# Altium schematic sheet 3V3_Buck.SchDoc
size A; Author: Jared Ainsworth; CompanyName: UpRev LLC; Engineer: Jared Ainsworth; Organization: UpRev LLC; Address1: 4807 Commercial Park Dr.; Address2: Austin, TX 78724; Address3: United States; Address4: www.UpRev.com; SheetNumber: 13; SheetTotal: 13
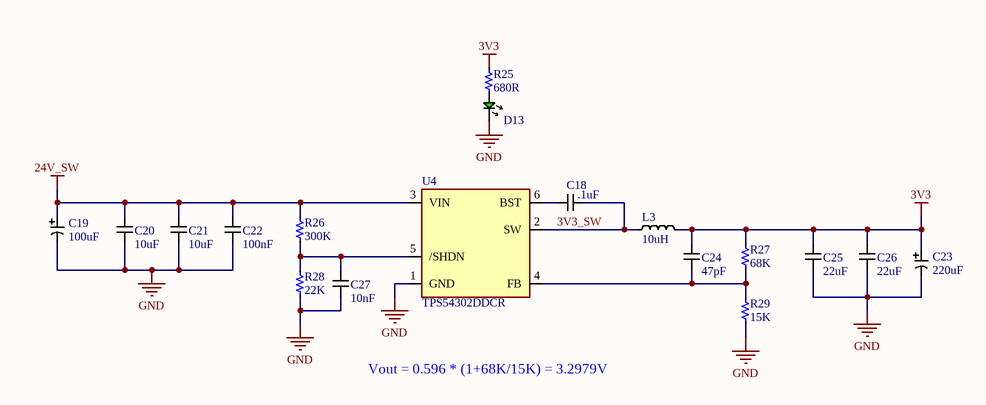
[diagram p0: 3V3_Buck.SchDoc]

## Parts
C18  .1uF  [C0805 (2012)]
C19  100uF  [Cap D8xL10.2mm]
C20  10uF  [C1206 (3216)]
C21  10uF  [C1206 (3216)]
C22  100nF  [C0603 (1608)]
C23  220uF  [Cap D6.3xL7.7mm]
C24  47pF  [C0402 (1005)]
C25  22uF  [C1206 (3216)]
C26  22uF  [C1206 (3216)]
C27  10nF  [C0402 (1005)]
D13  Green  [LED Green 0402 (1005)]  (value not drawn)
L3  10uH  [Inductor 7.2x6.6mm SMD]
R25  680R  [R0402 (1005)]
R26  300K  [R0402 (1005)]
R27  68K  [R0402 (1005)]
R28  22K  [R0402 (1005)]
R29  15K  [R0402 (1005)]
U4  TPS54302DDCR  [SOT-23-6]

## Nets
3V3: C23.1(+) C24.1 C25.1 C26.1 L3.2 R25.2 R27.2
24V_SW: C19.1(+) C20.1 C21.1 C22.1 R26.2 U4.3(VIN)
GND: C19.2 C20.2 C21.2 C22.2 C23.2 C25.2 C26.2 C27.2 D13.1(Gnd) R28.1 R29.1 U4.1(GND)
3V3_SW: C18.2 L3.1 U4.2(SW)
NetC18_1: C18.1 U4.6(BST)
NetC24_2: C24.2 R27.1 R29.2 U4.4(FB)
NetC27_1: C27.1 R26.1 R28.2 U4.5(/SHDN)
NetD13_2: D13.2(+) R25.1

## Notes on the sheet
- Vout = 0.596 * (1+68K/15K) = 3.2979V
- Title
- Size:
- Engineer:
- A
- Number:
- Revision:
- Sheet
- of
- File:

## Library data of the parts
C18 = 100nF Ceramic, 50V, 0805 (2012): 100nF Ceramic Capacitor, 50V, X7R, ±10%, 0805 (2012); Manufacturer Part Number: CL21B104KBCNNNC; Manufacturer: Samsung Electro-Mechanics; Package: 0805 (2012 metric); Value: .1uF; LCSC Part Number: C1711; Footprint: 0805
C19 = 100uF Aluminum Electrolytic, 50V, D8xL10.2mm: 100uF Aluminum Electrolytic Capacitor, 50V, ±20%, D8xL10.2mm; Manufacturer: ROQANG; Manufacturer Part Number: RVT1H101M0810; Package: SMD,D8xL10.2mm; Value: 100uF; LCSC Part Number: C72480
C20 C21 = 10uF Ceramic, 50V, 1206 (3216): 10uF Ceramic Capacitor, 50V, ±10%, 1206 (3216); Manufacturer Part Number: CL31A106KBHNNNE; Manufacturer: Samsung Electro-Mechanics; Package: 1206 (3216 metric); Value: 10uF; LCSC Part Number: C13585
C22 = 100nF Ceramic, 50V, 0603 (1608): 100nF Ceramic Capacitor, 50V, X7R, ±10%, 0603 (1608); Manufacturer Part Number: CC0603KRX7R9BB104; Manufacturer: YAGEO; Package: 0603 (1608 metric); Value: 100nF; LCSC Part Number: C14663
C23 = 220uF Aluminum Electrolytic, 25V, D6.3xL7.7mm_1: 220uF Aluminum Electrolytic Capacitor, 25V, ±20%, D6.3xL7.7mm; Manufacturer: ROQANG; Manufacturer Part Number: RVT1E221M0607; Package: SMD,D6.3xL7.7mm; Value: 220uF; LCSC Part Number: C2918361
C24 = 47pF Ceramic, 10V, 0402 (1005): 47pF Ceramic Capacitor, 50Vm C0G, ±5%, 0402 (1005); Manufacturer Part Number: TCC0402C0G470J500AT; Manufacturer: CCTC; Package: 0402 (1005 metric); LCSC Part Number: C466230; Value: 47pF
C25 C26 = 22uF Ceramic, 25V, 1206 (3216): 22uF Ceramic Capacitor, 25V, ±10%, 1206 (3216); Manufacturer Part Number: CL31A226KAHNNNE; Manufacturer: Samsung Electro-Mechanics; Package: 1206 (3216 metric); Value: 22uF; LCSC Part Number: C12891
C27 = 10nF Ceramic, 50V, 0402 (1005): 10nF Ceramic Capacitor, 50V, ±10%, 0402 (1005); Manufacturer Part Number: CL05B103KB5NNNC; Manufacturer: Samsung Electro-Mechanics; Package: 0402 (1005 metric); Value: 10nF; LCSC Part Number: C15195; Footprint: 0402
D13 = LED Green, 0402 (1005): Manufacturer Part Number: NCD0402G1; Manufacturer: Foshan NationStar Optoelectronics; Forward Current: 20mA; Color: Green; Package: 0402; LCSC Part Number: C130723
L3 = 10uH 6A, 7.2x6.6mm: 10uH Inductor, 5.5A, ±20%, 71mΩ, Shielded, 7.2x6mm; Manufacturer Part Number: CYA0630-10UH; Manufacturer: SHOU HAN; Package: SMD,7.2x6.6mm; LCSC Part Number: C5189958; Value: 10uH
R25 = 680 ohm, 0402 (1005): 680 ohm, Resistor, ±1%, 0402 (1005); Manufacturer: UNI-ROYAL(Uniroyal Elec); Manufacturer Part Number: 0402WGF6800TCE; Package: 0402 (1005 metric); LCSC Part Number: C25130; Value: 680R
R26 = 300K ohm, 0402 (1005): 300K ohm, Resistor, ±1%, 0402 (1005); Manufacturer: UNI-ROYAL(Uniroyal Elec); Manufacturer Part Number: 0402WGF3003TCE; Package: 0402 (1005 metric); LCSC Part Number: C25774; Value: 300K
R27 = 68K ohm, 0402 (1005): 68K ohm, Resistor, ±1%, 0402 (1005); Manufacturer: UNI-ROYAL(Uniroyal Elec); Manufacturer Part Number: 0402WGF6802TCE; Package: 0402 (1005 metric); LCSC Part Number: C36871; Value: 68K
R28 = 22K ohm, 0402 (1005): 22K ohm, Resistor, ±1%, 0402 (1005); Manufacturer: UNI-ROYAL(Uniroyal Elec); Manufacturer Part Number: 0402WGF2202TCE; Package: 0402 (1005 metric); LCSC Part Number: C25768; Value: 22K
R29 = 15K ohm, 0402 (1005): 15K ohm, Resistor, ±1%, 0402 (1005); Manufacturer: UNI-ROYAL(Uniroyal Elec); Manufacturer Part Number: 0402WGF1502TCE; Package: 0402 (1005 metric); LCSC Part Number: C25756; Value: 15K
U4 = TPS54302DDCR: Ti Switching V Regulator, Step Down, 3A, Ti TPS54302DDCR; Manufacturer Name: Texas Instruments; Manufacturer Part Number: TPS54302DDCR; Manufacturer: Texas Instruments; LCSC Part Number: C311983; Package: TSOT-23-6